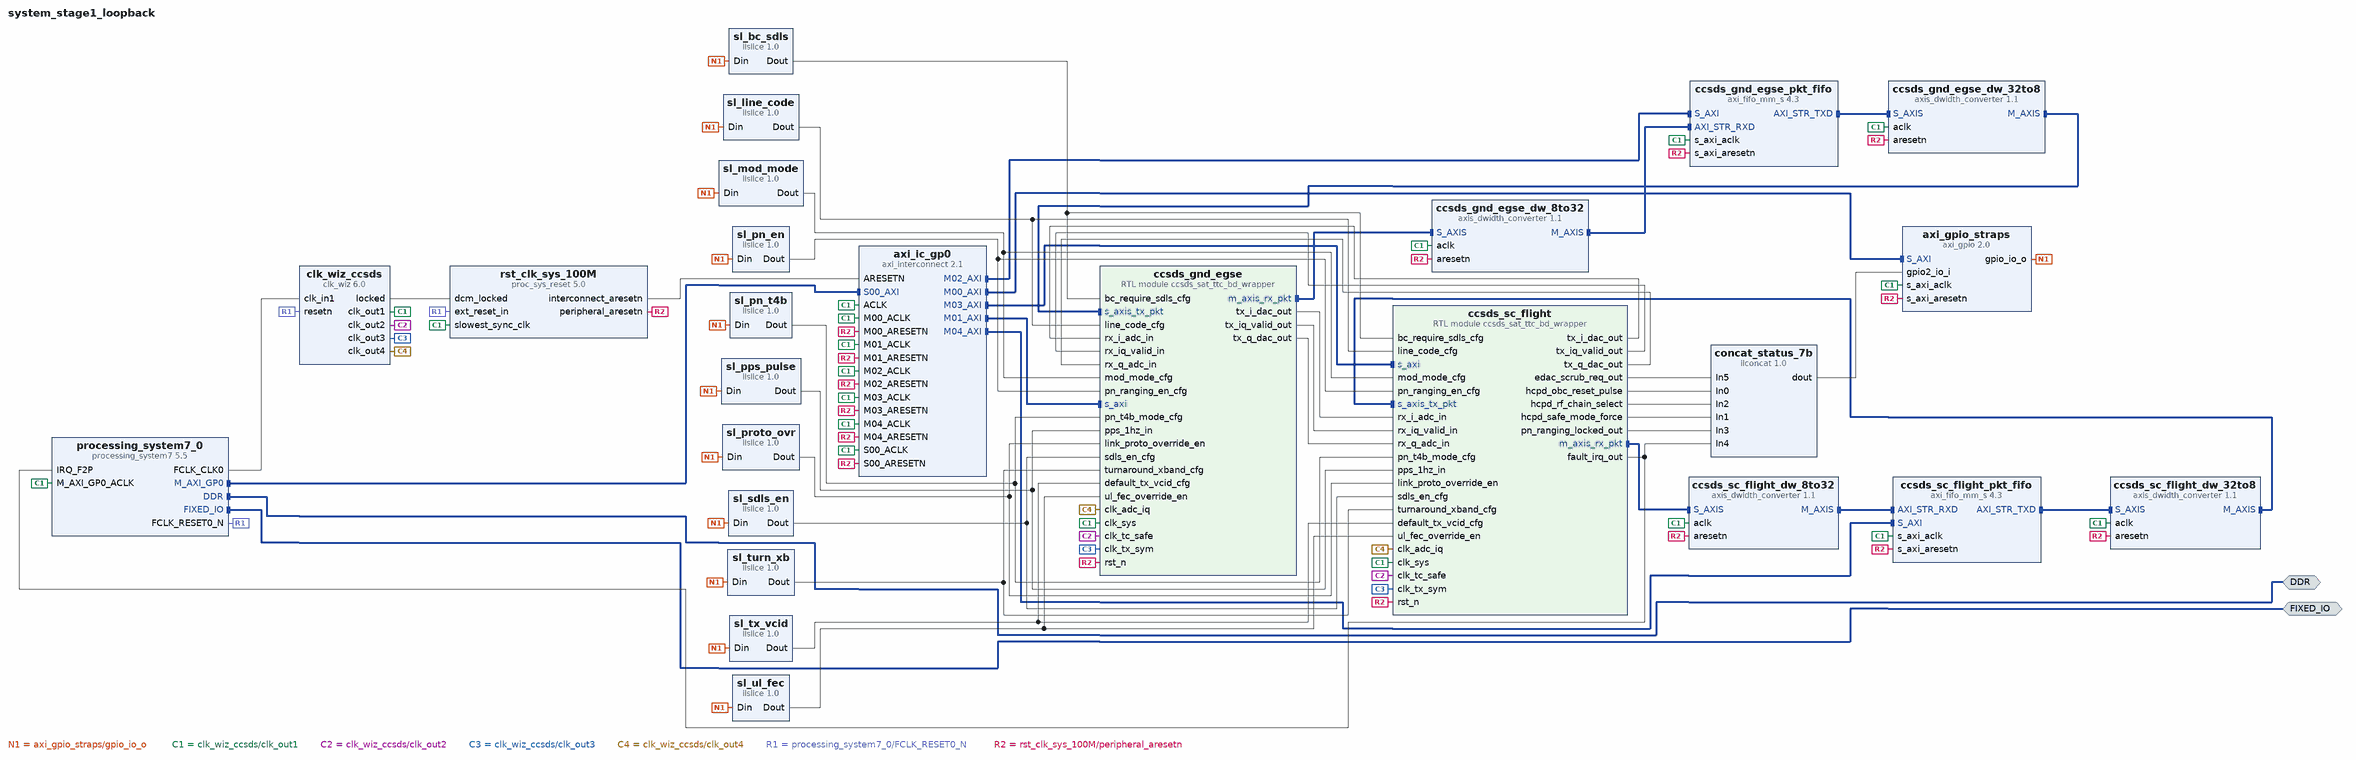
[diagram p0: block diagram of the top level]
# Vivado block design system_stage1_loopback, xc7z035ifbg676-2L, Vivado 2026.1.1
create_bd_design system_stage1_loopback

create_bd_intf_port -mode Master -vlnv xilinx.com:interface:ddrx_rtl:1.0 DDR
create_bd_intf_port -mode Master -vlnv xilinx.com:display_processing_system7:fixedio_rtl:1.0 FIXED_IO

create_bd_cell -type ip -vlnv xilinx.com:ip:processing_system7:5.5 processing_system7_0
set_property -dict [list \
  CONFIG.PCW_FPGA0_PERIPHERAL_FREQMHZ 100.0 \
  CONFIG.PCW_IRQ_F2P_INTR 1 \
  CONFIG.PCW_UART0_PERIPHERAL_ENABLE 1 \
  CONFIG.PCW_UART0_UART0_IO {MIO 14 .. 15} \
  CONFIG.PCW_UART_PERIPHERAL_FREQMHZ 100 \
  CONFIG.PCW_UIPARAM_DDR_PARTNO {MT41K256M16 RE-125} \
  CONFIG.PCW_USE_FABRIC_INTERRUPT 1 \
] [get_bd_cells processing_system7_0]
# 43 more settings of processing_system7_0 are not shown: defaults, MIO pin electricals, DDR timing, and values the tool derives
create_bd_cell -type ip -vlnv xilinx.com:ip:clk_wiz:6.0 clk_wiz_ccsds
set_property -dict [list \
  CONFIG.CLKOUT1_REQUESTED_OUT_FREQ 100.000 \
  CONFIG.CLKOUT2_REQUESTED_OUT_FREQ 16.000 \
  CONFIG.CLKOUT2_USED true \
  CONFIG.CLKOUT3_REQUESTED_OUT_FREQ 50.000 \
  CONFIG.CLKOUT3_USED true \
  CONFIG.CLKOUT4_REQUESTED_OUT_FREQ 120.000 \
  CONFIG.CLKOUT4_USED true \
  CONFIG.PRIM_IN_FREQ 100.000 \
  CONFIG.RESET_PORT resetn \
  CONFIG.RESET_TYPE ACTIVE_LOW \
] [get_bd_cells clk_wiz_ccsds]
create_bd_cell -type ip -vlnv xilinx.com:ip:proc_sys_reset:5.0 rst_clk_sys_100M
create_bd_cell -type ip -vlnv xilinx.com:ip:axi_interconnect:2.1 axi_ic_gp0
set_property -dict {CONFIG.NUM_MI 5 CONFIG.NUM_SI 1} [get_bd_cells axi_ic_gp0]
create_bd_cell -type ip -vlnv xilinx.com:ip:axi_gpio:2.0 axi_gpio_straps
set_property -dict [list \
  CONFIG.C_ALL_INPUTS_2 1 \
  CONFIG.C_ALL_OUTPUTS 1 \
  CONFIG.C_DOUT_DEFAULT 0x00000004 \
  CONFIG.C_GPIO2_WIDTH 7 \
  CONFIG.C_GPIO_WIDTH 20 \
  CONFIG.C_IS_DUAL 1 \
] [get_bd_cells axi_gpio_straps]
create_bd_cell -type inline_hdl -vlnv xilinx.com:inline_hdl:ilslice:1.0 sl_proto_ovr
set_property -dict {CONFIG.DIN_FROM 1 CONFIG.DIN_TO 0 CONFIG.DIN_WIDTH 20 CONFIG.DOUT_WIDTH 2} [get_bd_cells sl_proto_ovr]
create_bd_cell -type inline_hdl -vlnv xilinx.com:inline_hdl:ilslice:1.0 sl_ul_fec
set_property -dict {CONFIG.DIN_FROM 3 CONFIG.DIN_TO 2 CONFIG.DIN_WIDTH 20 CONFIG.DOUT_WIDTH 2} [get_bd_cells sl_ul_fec]
create_bd_cell -type inline_hdl -vlnv xilinx.com:inline_hdl:ilslice:1.0 sl_sdls_en
set_property -dict {CONFIG.DIN_FROM 4 CONFIG.DIN_TO 4 CONFIG.DIN_WIDTH 20 CONFIG.DOUT_WIDTH 1} [get_bd_cells sl_sdls_en]
create_bd_cell -type inline_hdl -vlnv xilinx.com:inline_hdl:ilslice:1.0 sl_bc_sdls
set_property -dict {CONFIG.DIN_FROM 5 CONFIG.DIN_TO 5 CONFIG.DIN_WIDTH 20 CONFIG.DOUT_WIDTH 1} [get_bd_cells sl_bc_sdls]
create_bd_cell -type inline_hdl -vlnv xilinx.com:inline_hdl:ilslice:1.0 sl_pn_en
set_property -dict {CONFIG.DIN_FROM 6 CONFIG.DIN_TO 6 CONFIG.DIN_WIDTH 20 CONFIG.DOUT_WIDTH 1} [get_bd_cells sl_pn_en]
create_bd_cell -type inline_hdl -vlnv xilinx.com:inline_hdl:ilslice:1.0 sl_pn_t4b
set_property -dict {CONFIG.DIN_FROM 7 CONFIG.DIN_TO 7 CONFIG.DIN_WIDTH 20 CONFIG.DOUT_WIDTH 1} [get_bd_cells sl_pn_t4b]
create_bd_cell -type inline_hdl -vlnv xilinx.com:inline_hdl:ilslice:1.0 sl_turn_xb
set_property -dict {CONFIG.DIN_FROM 8 CONFIG.DIN_TO 8 CONFIG.DIN_WIDTH 20 CONFIG.DOUT_WIDTH 1} [get_bd_cells sl_turn_xb]
create_bd_cell -type inline_hdl -vlnv xilinx.com:inline_hdl:ilslice:1.0 sl_mod_mode
set_property -dict {CONFIG.DIN_FROM 10 CONFIG.DIN_TO 9 CONFIG.DIN_WIDTH 20 CONFIG.DOUT_WIDTH 2} [get_bd_cells sl_mod_mode]
create_bd_cell -type inline_hdl -vlnv xilinx.com:inline_hdl:ilslice:1.0 sl_line_code
set_property -dict {CONFIG.DIN_FROM 12 CONFIG.DIN_TO 11 CONFIG.DIN_WIDTH 20 CONFIG.DOUT_WIDTH 2} [get_bd_cells sl_line_code]
create_bd_cell -type inline_hdl -vlnv xilinx.com:inline_hdl:ilslice:1.0 sl_tx_vcid
set_property -dict {CONFIG.DIN_FROM 18 CONFIG.DIN_TO 13 CONFIG.DIN_WIDTH 20 CONFIG.DOUT_WIDTH 6} [get_bd_cells sl_tx_vcid]
create_bd_cell -type inline_hdl -vlnv xilinx.com:inline_hdl:ilslice:1.0 sl_pps_pulse
set_property -dict {CONFIG.DIN_FROM 19 CONFIG.DIN_TO 19 CONFIG.DIN_WIDTH 20 CONFIG.DOUT_WIDTH 1} [get_bd_cells sl_pps_pulse]
create_bd_cell -type module -reference ccsds_sat_ttc_bd_wrapper ccsds_gnd_egse
set_property -dict [list \
  CONFIG.ENABLE_SDLS 1 \
  CONFIG.ENABLE_UL_LDPC 1 \
  CONFIG.IQ_BUS_WIDTH 16 \
  CONFIG.ROLE_MODE 1 \
  CONFIG.RX_MSB_ALIGNED 1 \
] [get_bd_cells ccsds_gnd_egse]
create_bd_cell -type ip -vlnv xilinx.com:ip:axi_fifo_mm_s:4.3 ccsds_gnd_egse_pkt_fifo
set_property -dict [list \
  CONFIG.C_DATA_INTERFACE_TYPE 0 \
  CONFIG.C_HAS_AXIS_TKEEP true \
  CONFIG.C_USE_RX_DATA 1 \
  CONFIG.C_USE_TX_CTRL 0 \
  CONFIG.C_USE_TX_DATA 1 \
] [get_bd_cells ccsds_gnd_egse_pkt_fifo]
create_bd_cell -type ip -vlnv xilinx.com:ip:axis_dwidth_converter:1.1 ccsds_gnd_egse_dw_32to8
set_property -dict {CONFIG.M_TDATA_NUM_BYTES 1 CONFIG.S_TDATA_NUM_BYTES 4} [get_bd_cells ccsds_gnd_egse_dw_32to8]
create_bd_cell -type ip -vlnv xilinx.com:ip:axis_dwidth_converter:1.1 ccsds_gnd_egse_dw_8to32
set_property -dict [list \
  CONFIG.HAS_MI_TKEEP 1 \
  CONFIG.M_TDATA_NUM_BYTES 4 \
  CONFIG.S_TDATA_NUM_BYTES 1 \
] [get_bd_cells ccsds_gnd_egse_dw_8to32]
create_bd_cell -type module -reference ccsds_sat_ttc_bd_wrapper ccsds_sc_flight
set_property -dict [list \
  CONFIG.ENABLE_SDLS 1 \
  CONFIG.ENABLE_UL_LDPC 1 \
  CONFIG.IQ_BUS_WIDTH 16 \
  CONFIG.ROLE_MODE 0 \
  CONFIG.RX_MSB_ALIGNED 1 \
] [get_bd_cells ccsds_sc_flight]
create_bd_cell -type ip -vlnv xilinx.com:ip:axi_fifo_mm_s:4.3 ccsds_sc_flight_pkt_fifo
set_property -dict [list \
  CONFIG.C_DATA_INTERFACE_TYPE 0 \
  CONFIG.C_HAS_AXIS_TKEEP true \
  CONFIG.C_USE_RX_DATA 1 \
  CONFIG.C_USE_TX_CTRL 0 \
  CONFIG.C_USE_TX_DATA 1 \
] [get_bd_cells ccsds_sc_flight_pkt_fifo]
create_bd_cell -type ip -vlnv xilinx.com:ip:axis_dwidth_converter:1.1 ccsds_sc_flight_dw_32to8
set_property -dict {CONFIG.M_TDATA_NUM_BYTES 1 CONFIG.S_TDATA_NUM_BYTES 4} [get_bd_cells ccsds_sc_flight_dw_32to8]
create_bd_cell -type ip -vlnv xilinx.com:ip:axis_dwidth_converter:1.1 ccsds_sc_flight_dw_8to32
set_property -dict [list \
  CONFIG.HAS_MI_TKEEP 1 \
  CONFIG.M_TDATA_NUM_BYTES 4 \
  CONFIG.S_TDATA_NUM_BYTES 1 \
] [get_bd_cells ccsds_sc_flight_dw_8to32]
create_bd_cell -type inline_hdl -vlnv xilinx.com:inline_hdl:ilconcat:1.0 concat_status_7b
set_property -dict {CONFIG.NUM_PORTS 6} [get_bd_cells concat_status_7b]

# ---- connections ----

connect_bd_intf_net [get_bd_intf_pins axi_ic_gp0/M00_AXI] [get_bd_intf_pins axi_gpio_straps/S_AXI]
connect_bd_intf_net [get_bd_intf_pins axi_ic_gp0/M01_AXI] [get_bd_intf_pins ccsds_gnd_egse/s_axi]
connect_bd_intf_net [get_bd_intf_pins axi_ic_gp0/M02_AXI] [get_bd_intf_pins ccsds_gnd_egse_pkt_fifo/S_AXI]
connect_bd_intf_net [get_bd_intf_pins axi_ic_gp0/M03_AXI] [get_bd_intf_pins ccsds_sc_flight/s_axi]
connect_bd_intf_net [get_bd_intf_pins axi_ic_gp0/M04_AXI] [get_bd_intf_pins ccsds_sc_flight_pkt_fifo/S_AXI]
connect_bd_intf_net [get_bd_intf_pins ccsds_gnd_egse_dw_32to8/M_AXIS] [get_bd_intf_pins ccsds_gnd_egse/s_axis_tx_pkt]
connect_bd_intf_net [get_bd_intf_pins ccsds_gnd_egse_dw_8to32/M_AXIS] [get_bd_intf_pins ccsds_gnd_egse_pkt_fifo/AXI_STR_RXD]
connect_bd_intf_net [get_bd_intf_pins ccsds_gnd_egse/m_axis_rx_pkt] [get_bd_intf_pins ccsds_gnd_egse_dw_8to32/S_AXIS]
connect_bd_intf_net [get_bd_intf_pins ccsds_gnd_egse_pkt_fifo/AXI_STR_TXD] [get_bd_intf_pins ccsds_gnd_egse_dw_32to8/S_AXIS]
connect_bd_intf_net [get_bd_intf_pins ccsds_sc_flight_dw_32to8/M_AXIS] [get_bd_intf_pins ccsds_sc_flight/s_axis_tx_pkt]
connect_bd_intf_net [get_bd_intf_pins ccsds_sc_flight_dw_8to32/M_AXIS] [get_bd_intf_pins ccsds_sc_flight_pkt_fifo/AXI_STR_RXD]
connect_bd_intf_net [get_bd_intf_pins ccsds_sc_flight/m_axis_rx_pkt] [get_bd_intf_pins ccsds_sc_flight_dw_8to32/S_AXIS]
connect_bd_intf_net [get_bd_intf_pins ccsds_sc_flight_pkt_fifo/AXI_STR_TXD] [get_bd_intf_pins ccsds_sc_flight_dw_32to8/S_AXIS]
connect_bd_intf_net [get_bd_intf_ports DDR] [get_bd_intf_pins processing_system7_0/DDR]
connect_bd_intf_net [get_bd_intf_ports FIXED_IO] [get_bd_intf_pins processing_system7_0/FIXED_IO]
connect_bd_intf_net [get_bd_intf_pins processing_system7_0/M_AXI_GP0] [get_bd_intf_pins axi_ic_gp0/S00_AXI]
connect_bd_net [get_bd_pins axi_gpio_straps/gpio_io_o] \
  [get_bd_pins sl_proto_ovr/Din] [get_bd_pins sl_ul_fec/Din] [get_bd_pins sl_sdls_en/Din] [get_bd_pins sl_bc_sdls/Din] \
  [get_bd_pins sl_pn_en/Din] [get_bd_pins sl_pn_t4b/Din] [get_bd_pins sl_turn_xb/Din] [get_bd_pins sl_mod_mode/Din] \
  [get_bd_pins sl_line_code/Din] [get_bd_pins sl_tx_vcid/Din] [get_bd_pins sl_pps_pulse/Din]
connect_bd_net [get_bd_pins ccsds_gnd_egse/tx_i_dac_out] [get_bd_pins ccsds_sc_flight/rx_i_adc_in]
connect_bd_net [get_bd_pins ccsds_gnd_egse/tx_iq_valid_out] [get_bd_pins ccsds_sc_flight/rx_iq_valid_in]
connect_bd_net [get_bd_pins ccsds_gnd_egse/tx_q_dac_out] [get_bd_pins ccsds_sc_flight/rx_q_adc_in]
connect_bd_net [get_bd_pins ccsds_sc_flight/edac_scrub_req_out] [get_bd_pins concat_status_7b/In5]
connect_bd_net [get_bd_pins ccsds_sc_flight/fault_irq_out] [get_bd_pins concat_status_7b/In4] [get_bd_pins processing_system7_0/IRQ_F2P]
connect_bd_net [get_bd_pins ccsds_sc_flight/hcpd_obc_reset_pulse] [get_bd_pins concat_status_7b/In0]
connect_bd_net [get_bd_pins ccsds_sc_flight/hcpd_rf_chain_select] [get_bd_pins concat_status_7b/In2]
connect_bd_net [get_bd_pins ccsds_sc_flight/hcpd_safe_mode_force] [get_bd_pins concat_status_7b/In1]
connect_bd_net [get_bd_pins ccsds_sc_flight/pn_ranging_locked_out] [get_bd_pins concat_status_7b/In3]
connect_bd_net [get_bd_pins ccsds_sc_flight/tx_i_dac_out] [get_bd_pins ccsds_gnd_egse/rx_i_adc_in]
connect_bd_net [get_bd_pins ccsds_sc_flight/tx_iq_valid_out] [get_bd_pins ccsds_gnd_egse/rx_iq_valid_in]
connect_bd_net [get_bd_pins ccsds_sc_flight/tx_q_dac_out] [get_bd_pins ccsds_gnd_egse/rx_q_adc_in]
connect_bd_net [get_bd_pins clk_wiz_ccsds/clk_out1] \
  [get_bd_pins rst_clk_sys_100M/slowest_sync_clk] [get_bd_pins processing_system7_0/M_AXI_GP0_ACLK] \
  [get_bd_pins axi_ic_gp0/ACLK] [get_bd_pins axi_ic_gp0/S00_ACLK] [get_bd_pins axi_ic_gp0/M00_ACLK] \
  [get_bd_pins axi_ic_gp0/M01_ACLK] [get_bd_pins axi_ic_gp0/M02_ACLK] [get_bd_pins axi_ic_gp0/M03_ACLK] \
  [get_bd_pins axi_ic_gp0/M04_ACLK] [get_bd_pins axi_gpio_straps/s_axi_aclk] [get_bd_pins ccsds_gnd_egse_pkt_fifo/s_axi_aclk] \
  [get_bd_pins ccsds_gnd_egse_dw_32to8/aclk] [get_bd_pins ccsds_gnd_egse_dw_8to32/aclk] \
  [get_bd_pins ccsds_sc_flight_pkt_fifo/s_axi_aclk] [get_bd_pins ccsds_sc_flight_dw_32to8/aclk] \
  [get_bd_pins ccsds_sc_flight_dw_8to32/aclk] [get_bd_pins ccsds_gnd_egse/clk_sys] [get_bd_pins ccsds_sc_flight/clk_sys]
connect_bd_net [get_bd_pins clk_wiz_ccsds/clk_out2] [get_bd_pins ccsds_gnd_egse/clk_tc_safe] [get_bd_pins ccsds_sc_flight/clk_tc_safe]
connect_bd_net [get_bd_pins clk_wiz_ccsds/clk_out3] [get_bd_pins ccsds_gnd_egse/clk_tx_sym] [get_bd_pins ccsds_sc_flight/clk_tx_sym]
connect_bd_net [get_bd_pins clk_wiz_ccsds/clk_out4] [get_bd_pins ccsds_gnd_egse/clk_adc_iq] [get_bd_pins ccsds_sc_flight/clk_adc_iq]
connect_bd_net [get_bd_pins clk_wiz_ccsds/locked] [get_bd_pins rst_clk_sys_100M/dcm_locked]
connect_bd_net [get_bd_pins concat_status_7b/dout] [get_bd_pins axi_gpio_straps/gpio2_io_i]
connect_bd_net [get_bd_pins processing_system7_0/FCLK_CLK0] [get_bd_pins clk_wiz_ccsds/clk_in1]
connect_bd_net [get_bd_pins processing_system7_0/FCLK_RESET0_N] [get_bd_pins clk_wiz_ccsds/resetn] [get_bd_pins rst_clk_sys_100M/ext_reset_in]
connect_bd_net [get_bd_pins rst_clk_sys_100M/interconnect_aresetn] [get_bd_pins axi_ic_gp0/ARESETN]
connect_bd_net [get_bd_pins rst_clk_sys_100M/peripheral_aresetn] \
  [get_bd_pins axi_ic_gp0/S00_ARESETN] [get_bd_pins axi_ic_gp0/M00_ARESETN] [get_bd_pins axi_ic_gp0/M01_ARESETN] \
  [get_bd_pins axi_ic_gp0/M02_ARESETN] [get_bd_pins axi_ic_gp0/M03_ARESETN] [get_bd_pins axi_ic_gp0/M04_ARESETN] \
  [get_bd_pins axi_gpio_straps/s_axi_aresetn] [get_bd_pins ccsds_gnd_egse_pkt_fifo/s_axi_aresetn] \
  [get_bd_pins ccsds_gnd_egse_dw_32to8/aresetn] [get_bd_pins ccsds_gnd_egse_dw_8to32/aresetn] \
  [get_bd_pins ccsds_sc_flight_pkt_fifo/s_axi_aresetn] [get_bd_pins ccsds_sc_flight_dw_32to8/aresetn] \
  [get_bd_pins ccsds_sc_flight_dw_8to32/aresetn] [get_bd_pins ccsds_gnd_egse/rst_n] [get_bd_pins ccsds_sc_flight/rst_n]
connect_bd_net [get_bd_pins sl_bc_sdls/Dout] [get_bd_pins ccsds_gnd_egse/bc_require_sdls_cfg] [get_bd_pins ccsds_sc_flight/bc_require_sdls_cfg]
connect_bd_net [get_bd_pins sl_line_code/Dout] [get_bd_pins ccsds_gnd_egse/line_code_cfg] [get_bd_pins ccsds_sc_flight/line_code_cfg]
connect_bd_net [get_bd_pins sl_mod_mode/Dout] [get_bd_pins ccsds_gnd_egse/mod_mode_cfg] [get_bd_pins ccsds_sc_flight/mod_mode_cfg]
connect_bd_net [get_bd_pins sl_pn_en/Dout] [get_bd_pins ccsds_gnd_egse/pn_ranging_en_cfg] [get_bd_pins ccsds_sc_flight/pn_ranging_en_cfg]
connect_bd_net [get_bd_pins sl_pn_t4b/Dout] [get_bd_pins ccsds_gnd_egse/pn_t4b_mode_cfg] [get_bd_pins ccsds_sc_flight/pn_t4b_mode_cfg]
connect_bd_net [get_bd_pins sl_pps_pulse/Dout] [get_bd_pins ccsds_gnd_egse/pps_1hz_in] [get_bd_pins ccsds_sc_flight/pps_1hz_in]
connect_bd_net [get_bd_pins sl_proto_ovr/Dout] \
  [get_bd_pins ccsds_gnd_egse/link_proto_override_en] [get_bd_pins ccsds_sc_flight/link_proto_override_en]
connect_bd_net [get_bd_pins sl_sdls_en/Dout] [get_bd_pins ccsds_gnd_egse/sdls_en_cfg] [get_bd_pins ccsds_sc_flight/sdls_en_cfg]
connect_bd_net [get_bd_pins sl_turn_xb/Dout] [get_bd_pins ccsds_gnd_egse/turnaround_xband_cfg] [get_bd_pins ccsds_sc_flight/turnaround_xband_cfg]
connect_bd_net [get_bd_pins sl_tx_vcid/Dout] [get_bd_pins ccsds_gnd_egse/default_tx_vcid_cfg] [get_bd_pins ccsds_sc_flight/default_tx_vcid_cfg]
connect_bd_net [get_bd_pins sl_ul_fec/Dout] [get_bd_pins ccsds_gnd_egse/ul_fec_override_en] [get_bd_pins ccsds_sc_flight/ul_fec_override_en]

# ---- address map ----
assign_bd_address -offset 0x41200000 -range 64K -target_address_space [get_bd_addr_spaces processing_system7_0/Data] [get_bd_addr_segs axi_gpio_straps/S_AXI/Reg]
assign_bd_address -offset 0x43C00000 -range 4K -target_address_space [get_bd_addr_spaces processing_system7_0/Data] [get_bd_addr_segs ccsds_gnd_egse/s_axi/reg0]
assign_bd_address -offset 0x43C10000 -range 64K -target_address_space [get_bd_addr_spaces processing_system7_0/Data] [get_bd_addr_segs ccsds_gnd_egse_pkt_fifo/S_AXI/Mem0]
assign_bd_address -offset 0x43C20000 -range 4K -target_address_space [get_bd_addr_spaces processing_system7_0/Data] [get_bd_addr_segs ccsds_sc_flight/s_axi/reg0]
assign_bd_address -offset 0x43C30000 -range 64K -target_address_space [get_bd_addr_spaces processing_system7_0/Data] [get_bd_addr_segs ccsds_sc_flight_pkt_fifo/S_AXI/Mem0]

validate_bd_design
save_bd_design
